# Altium project HDMI_To_FPCadaptor_V1.0.PrjPcb (part 2 of 2)

## Sheet Controller_Section.SchDoc
size A4; SheetNumber: 3; SheetTotal: 5
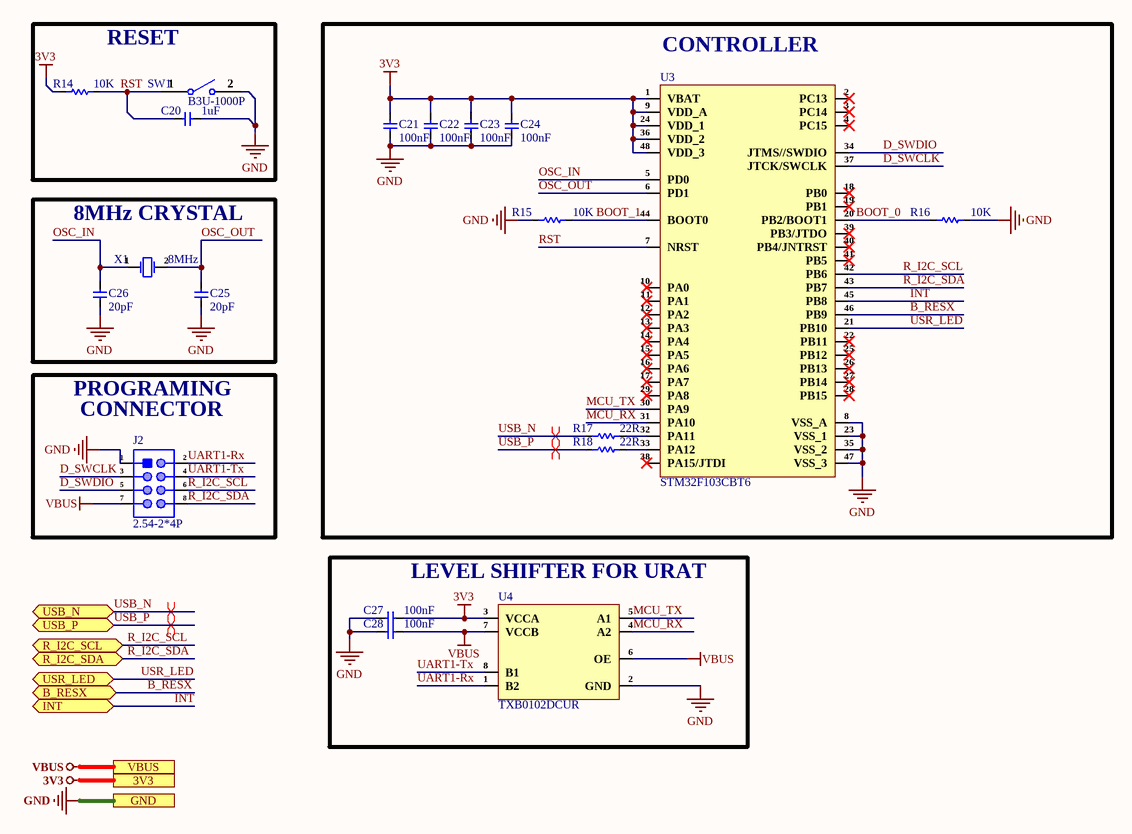
[diagram p3: Controller_Section.SchDoc]

### Parts
C20  1uF  [Cap-0603]
C21  100nF  [Cap-0603]
C22  100nF  [Cap-0603]
C23  100nF  [Cap-0603]
C24  100nF  [Cap-0603]
C25  20pF  [Cap-0603]
C26  20pF  [Cap-0603]
C27  100nF  [Cap-0603]
C28  100nF  [Cap-0603]
J2  2.54-2*4P  [C192300]
R14  10K  [Res-0603]
R15  10K  [Res-0603]
R16  10K  [Res-0603]
R17  22R  [Res-0603]
R18  22R  [Res-0603]
SW1  B3U-1000P  [B3U-1000P]
U3  STM32F103CBT6  [48-LQFP (7x7)_]
U4  TXB0102DCUR  [VSSOP-8(3.1x2.1)]
X1  8MHz  [SMD5032-2P]

### Blocks framed on the sheet
RESET: C20 R14 SW1
CONTROLLER: C21-C24 R15-R18 U3
8MHz CRYSTAL: C25 C26 X1
LEVEL SHIFTER FOR URAT: C27 C28 U4

### Ports
3V3 (see Top_Sheet[2B], HDMI_to_MIPI_Section[1D], Power_Section[3C]), B_RESX (bidir, see Top_Sheet[3B], HDMI_to_MIPI_Section[1C]), GND (see Top_Sheet[3B], Connector_Section[3C], HDMI_to_MIPI_Section[1D], Power_Section[3C]), INT (bidir, see Top_Sheet[3B], HDMI_to_MIPI_Section[1C]), R_I2C_SCL (bidir, see Top_Sheet[3B], HDMI_to_MIPI_Section[1C]), R_I2C_SDA (bidir, see Top_Sheet[3B], HDMI_to_MIPI_Section[1C]), USB_N (bidir, see Top_Sheet[2B], Power_Section[2C]), USB_P (bidir, see Top_Sheet[2B], Power_Section[2C]), USR_LED (bidir, see Top_Sheet[2B], Power_Section[2C]), VBUS (see Top_Sheet[2B], Connector_Section[3C], Power_Section[3C])

### Nets
3V3: C21.2 C22.2 C23.2 C24.2 C27.1 R14.1 U3.1(VBAT) U3.9(VDD_A) U3.24(VDD_1) U3.36(VDD_2) U3.48(VDD_3) U4.3(VCCA) ; port 3V3
GND: C20.2 C21.1 C22.1 C23.1 C24.1 C25.1 C26.1 C27.2 C28.2 J2.1 R15.1 R16.2 SW1.2 U3.8(VSS_A) U3.23(VSS_1) U3.35(VSS_2) U3.47(VSS_3) U4.2(GND) ; port GND
VBUS: C28.1 J2.7 U4.6(OE) U4.7(VCCB) ; port VBUS
B_RESX: U3.46(PB9) ; port B_RESX
BOOT_0: R16.1 U3.20(PB2/BOOT1)
BOOT_1: R15.2 U3.44(BOOT0)
D_SWCLK: J2.3 U3.37(JTCK/SWCLK)
D_SWDIO: J2.5 U3.34(JTMS//SWDIO)
INT: U3.45(PB8) ; port INT
MCU_RX: U3.31(PA10) U4.4(A2)
MCU_TX: U3.30(PA9) U4.5(A1)
OSC_IN: C26.2 U3.5(PD0) X1.1(OSC1)
OSC_OUT: C25.2 U3.6(PD1) X1.2(OSC2)
R_I2C_SCL: J2.6 U3.42(PB6) ; port R_I2C_SCL
R_I2C_SDA: J2.8 U3.43(PB7) ; port R_I2C_SDA
RST: C20.1 R14.2 SW1.1 U3.7(NRST)
UART1-Rx: J2.2 U4.1(B2)
UART1-Tx: J2.4 U4.8(B1)
USB_N: R17.1 ; port USB_N
USB_P: R18.1 ; port USB_P
USR_LED: U3.21(PB10) ; port USR_LED
NetR17_2: R17.2 U3.32(PA11)
NetR18_2: R18.2 U3.33(PA12)

Not connected (* = marked no-connect by the designer): U3 2(PC13)* 3(PC14)* 4(PC15)* 10(PA0)* 11(PA1)* 12(PA2)* 13(PA3)* 14(PA4)* 15(PA5)* 16(PA6)* 17(PA7)* 18(PB0)* 19(PB1)* 22(PB11)* 25(PB12)* 26(PB13)* 27(PB14)* 28(PB15)* 29(PA8)* 38(PA15/JTDI)* 39(PB3/JTDO)* 40(PB4/JNTRST)* 41(PB5)*

### Layout directives
differential pair; net class USB; differential pair class USB_Lines; rule Impedance Constraint [Min = 85.00    Max = 90.00    ]; rule Matched Net Lengths [Tolerance = 50mil]: USB_N, USB_P

### Notes on the sheet
- PROGRAMING
- (near J2) CONNECTOR
- File:
- Title:
- Date:
- Page
- Num:
- Total:
- Drawn By: Huzaifa Ali

### Library data of the parts
C20 = CL10A105KO8NNNC: 16V 1uF X5R ±10% 0603 Multilayer Ceramic Capacitors MLCC - SMD/SMT ROHS; Manufacturer: Samsung Electro-Mechanics; Manufacturer Part Number: CL10A105KO8NNNC; Package: 0603; LCSC Part Number: C1592; Item Type: Capacitor; ComponentLink1Description: LCSC; ComponentLink1URL: https://www.lcsc.com/product-detail/Multilayer-Ceramic-Capacitors-MLCC-SMD-SMT_Samsung-Electro-Mechanics-CL10A105KO8NNNC_C1592.html
C21-C24 C27 C28 = CL10B104KA8NNNC: 25V 100nF X7R ±10% 0603 Multilayer Ceramic Capacitors MLCC - SMD/SMT ROHS; Manufacturer: Samsung Electro-Mechanics; ComponentLink1Description: LCSC; ComponentLink1URL: https://www.lcsc.com/product-detail/Multilayer-Ceramic-Capacitors-MLCC-SMD-SMT_Samsung-Electro-Mechanics-CL10B104KA8NNNC_C1590.html; Manufacturer Part Number: CL10B104KA8NNNC; Package: 0603; LCSC Part Number: C1590; Item Type: Capacitor
C25 C26 = CC0603JRNPO9BN200: CAP CER 20PF 50V C0G/NPO 0603; Manufacturer: Yageo; Tolerance: 5%; Dielectric: C0G; Item Type: Capacitor; Supplier 1: Digi-Key; Manufacturer Part Number: CC0603JRNPO9BN200; Stock 1: 259568; Pricing 1: 1=0.1, 10=0.048, 100=0.0214, 500=0.01526, 1000=0.01198 (USD); Mount: Surface Mount; Case/Package: 0603; Number of Pins: 2; Weight: 7.1E-05oz; Case Code (Imperial): 0603; Case Code (Metric): 1608; Min Operating Temperature: -55°C; Max Operating Temperature: 125°C; Capacitance: 20pF; Package Quantity: 4000; Voltage Rating (DC): 50V; Packaging: Tape and Reel; Voltage Rating: 50V; Termination: SMD/SMT; Composition: Ceramic; Length: 1.6mm; Width: 0.8mm; Thickness: 0.035inch; Depth: 0.8mm; REACH SVHC: Unknown; Lead Free: Lead Free; ComponentLink1URL: http://www.farnell.com/datasheets/1132289.pdf?src-supplier=Element14; ComponentLink1Description: http://www.farnell.com/datasheets/1132289.pdf?src-supplier=Element14; ComponentLink2URL: http://www.yageo.com/documents/recent/UPY-GP_NP0_16V-to-50V_16.pdf?src-supplier=Digi-Key; ComponentLink2Description: http://www.yageo.com/documents/recent/UPY-GP_NP0_16V-to-50V_16.pdf?src-supplier=Digi-Key; Supplier Part Number 1: 311-1424-6-ND; LCSC Part Number: C105621
J2 = 2.54-2*4P: 3A Brick nogging Square Pins 2.5mm 8P 6mm -55℃~+105℃ 2.54mm 双排 Black 2x4P 2.54mm SMD,P=2.54mm Pin Headers ROHS; Manufacturer: BOOMELE(BOOM Precision Elec); Item Type: Male; Manufacturer Part Number: 2.54-2*4P; Package: SMD,P=2.54mm; LCSC Part Number: C192300; ComponentLink1Description: LCSC; ComponentLink1URL: https://www.lcsc.com/product-detail/Pin-Headers_BOOMELE-Boom-Precision-Elec-C192300_C192300.html
R14-R16 = 0603WAF1002T5E: 100mW Thick Film Resistors 75V ±100ppm/℃ ±1% 10kΩ 0603 Chip Resistor - Surface Mount ROHS; Manufacturer: UNI-ROYAL(Uniroyal Elec); Manufacturer Part Number: 0603WAF1002T5E; Value: 10K; Package: 0603; ComponentLink1Description: LCSC; ComponentLink1URL: https://www.lcsc.com/product-detail/Chip-Resistor-Surface-Mount_UNI-ROYAL-Uniroyal-Elec-0603WAF1002T5E_C25804.html; LCSC Part Number: C25804; Item Type: Resistor
R17 R18 = 0603WAF220JT5E: 100mW Thick Film Resistors 75V ±100ppm/℃ ±1% 22Ω 0603 Chip Resistor - Surface Mount ROHS; Manufacturer: UNI-ROYAL(Uniroyal Elec); Manufacturer Part Number: 0603WAF220JT5E; Value: 22R; Footprint: 0603; ComponentLink1Description: LCSC; ComponentLink1URL: https://www.lcsc.com/product-detail/Chip-Resistor-Surface-Mount_UNI-ROYAL-Uniroyal-Elec-0603WAF220JT5E_C23345.html; LCSC Part Number: C23345; Item Type: Resistor
SW1 = B3U-1000P: SWITCH TACTILE SPST-NO 0.05A 12V; Manufacturer: Omron; Mechanical Life: 200000Cycles; Operating Force: 1.5N; Throw Configuration: SPST; Current Rating: 50mA; Contact Resistance: 100mR; Illumination Type: Non-Illuminated,Illuminated; Switch Travel: 0.15mm; Switch Function: Off-Mom; Actuator Type: Standard; Actuator Length: 0.4mm; Ratings: Dust Proof,IP40; ComponentLink1URL: http://www.farnell.com/datasheets/60838.pdf?src-supplier=Farnell; ComponentLink1Description: http://www.farnell.com/datasheets/60838.pdf?src-supplier=Farnell; ComponentLink2URL: http://www.farnell.com/datasheets/60838.pdf?src-supplier=Element14; ComponentLink2Description: http://www.farnell.com/datasheets/60838.pdf?src-supplier=Element14; ComponentLink3URL: https://omronfs.omron.com/en_US/ecb/products/pdf/en-b3u.pdf?src-supplier=Digi-Key; ComponentLink3Description: https://omronfs.omron.com/en_US/ecb/products/pdf/en-b3u.pdf?src-supplier=Digi-Key; ComponentLink4URL: http://www.omron.com/ecb/products/pdf/en-b3u.pdf?src-supplier=Digi-Key; ComponentLink4Description: http://www.omron.com/ecb/products/pdf/en-b3u.pdf?src-supplier=Digi-Key; ComponentLink5URL: https://www.distrelec.biz/Web/Downloads/he/et/B3U_eng_datasheet.pdf?mime=application%2Fpdf&src-supplier=Distrelec; ComponentLink5Description: https://www.distrelec.biz/Web/Downloads/he/et/B3U_eng_datasheet.pdf?mime=application%2Fpdf&src-supplier=Distrelec; ComponentLink6URL: http://www.onlinecomponents.com/productFiles/mf-OM/en-b3u.pdf?src-supplier=Onlinecomponents.com; ComponentLink6Description: http://www.onlinecomponents.com/productFiles/mf-OM/en-b3u.pdf?src-supplier=Onlinecomponents.com; Supplier 1: Digi-Key; Manufacturer Part Number: B3U-1000P; Stock 1: 116454; Pricing 1: 1=1, 10=0.961, 25=0.9064, 50=0.7976, 100=0.7251, 250=0.68888, 500=0.67074, 1000=0.52571 (USD); Mount: Surface Mount; Weight: 0.000776oz; Contact Material: Silver; Min Operating Temperature: -25°C; Max Operating Temperature: 70°C; Packaging: Tape and Reel; Voltage Rating (DC): 12V; Package Quantity: 1; Max Current Rating: 50mA; Termination: SMD/SMT; Orientation: Straight; Max Voltage Rating (DC): 12V; Electrical Life: 200000Cycles; Insulation Resistance: 100MR; Contact Current Rating: 50mA; Length: 4mm; Height: 1.2mm; Depth: 2.5mm; Width: 3mm; REACH SVHC: Unknown; Lead Free: Lead Free; ComponentLink7URL: https://www.verical.com/server-webapp/html/getDatasheet?partID=552554&src-supplier=Verical; ComponentLink7Description: https://www.verical.com/server-webapp/html/getDatasheet?partID=552554&src-supplier=Verical; ComponentLink8URL: http://www.farnell.com/datasheets/1685550.pdf?src-supplier=Element14; ComponentLink8Description: http://www.farnell.com/datasheets/1685550.pdf?src-supplier=Element14; ComponentLink9URL: http://www.farnell.com/datasheets/2610940.pdf?src-supplier=Farnell; ComponentLink9Description: http://www.farnell.com/datasheets/2610940.pdf?src-supplier=Farnell; ComponentLink10URL: https://www.alliedelec.com/m/d/4c8a9ef82804fc3c241a13c1e298fd73.pdf?src-supplier=Allied+Electronics; ComponentLink10Description: https://www.alliedelec.com/m/d/4c8a9ef82804fc3c241a13c1e298fd73.pdf?src-supplier=Allied+Electronics; Supplier Part Number 1: SW1020DKR-ND; LCSC Part Number: C231329; Item Type: Switch
U3 = STM32F103CBT6: IC MCU 32BIT 128KB FLASH 48LQFP; Manufacturer: STMicroelectronics; RAM Size: 20KB; Max Power Dissipation: 363mW; Interface: I2C,SPI,USB,CAN,IrDA,UART,USART,LIN; Number of I/Os: 37; Number of Timers/Counters: 4; Max Supply Voltage: 3.6V; Number of PWM Channels: 12; Frequency: 72MHz; Number of ADC Channels: 10; Min Supply Voltage: 2V; Oscillator Type: Internal; Data Bus Width: 32b; Number of Bits: 32; Number of SPI Channels: 2; Watchdog Timer: Yes; Peripherals: POR,PWM,WDT,DMA,Temp Sensor,I2C; Core Architecture: ARM; Supplier: Mouser; Supplier Part Number: 511-STM32F103CBT6; Manufacturer Part Number: STM32F103CBT6; RoHS: Yes; Category: Microcontrollers; Stock: 3552; Pricing: 1=7.35, 10=6.65, 50=5.53, 100=5.49, 1000=4.31, 10000=4.25 (USD); Case/Package: LQFP; Pins: 48; Min Operating Temperature: -40°C; Max Operating Temperature: 85°C; Package Quantity: 250; Density: 128KB; Packaging: Tray; Number of Programmable I/O: 37; Clock Frequency: 72MHz; Number of I2C Channels: 2; Memory Format: FLASH; Termination: SMD/SMT; Address Bus Width: 32b; Memory Size: 128KB; Series: STM32 F1; Length: 7mm; Width: 7.2mm; Height: 1.45mm; Radiation Hardening: No; Reach SVHC Compliant: No; Lead Free: Lead Free; RoHS Compliant: Yes; ComponentLink1URL: https://datasheet.ciiva.com/23669/1714663-23669200.pdf?src-supplier=Newark; ComponentLink1Description: https://datasheet.ciiva.com/23669/1714663-23669200.pdf?src-supplier=Newark; ComponentLink2URL: https://datasheet.ciiva.com/15122/getdatasheetpartid-92132-15122195.pdf?src-supplier=Verical; ComponentLink2Description: https://datasheet.ciiva.com/15122/getdatasheetpartid-92132-15122195.pdf?src-supplier=Verical; ComponentLink3URL: https://datasheet.ciiva.com/5752/cd00161566-5752838.pdf?src-supplier=Farnell; ComponentLink3Description: https://datasheet.ciiva.com/5752/cd00161566-5752838.pdf?src-supplier=Farnell; ComponentLink4URL: https://datasheet.ciiva.com/14100/pustm-arm-microcont-stm32f103-en-14100509.pdf?src-supplier=Distrelec; ComponentLink4Description: https://datasheet.ciiva.com/14100/pustm-arm-microcont-stm32f103-en-14100509.pdf?src-supplier=Distrelec; ComponentLink5URL: https://datasheet.ciiva.com/1502/cd00161566-1502328.pdf?src-supplier=Digi-Key; ComponentLink5Description: https://datasheet.ciiva.com/1502/cd00161566-1502328.pdf?src-supplier=Digi-Key; ComponentLink6URL: https://datasheet.ciiva.com/4840/cd00161566-4840398.pdf?src-supplier=Mouser; ComponentLink6Description: https://datasheet.ciiva.com/4840/cd00161566-4840398.pdf?src-supplier=Mouser; ComponentLink7URL: https://datasheet.ciiva.com/16219/cd00161566-16219150.pdf?src-supplier=Future+Electronics; ComponentLink7Description: https://datasheet.ciiva.com/16219/cd00161566-16219150.pdf?src-supplier=Future+Electronics; Item Type: IC; LCSC Part Number: C8304
U4 = TXB0102DCUR: IC TRANSLTR BIDIRECTIONAL 8VSSOP; Manufacturer: Texas Instruments; Number of Circuits: 1; Nominal Supply Current: 3.5uA; Number of Inputs: 1NUMBER; Max Supply Voltage: 5.5V; Min Supply Voltage: 1.2V; Propagation Delay: 7.4ns; Data Rate: 100Mbps; Logic Function: Translator; Number of Bits: 2; Turn-On Delay Time: 31ns; High Level Output Current: -20uA; Low Level Output Current: 20uA; Output Type: 3-STATE; Supplier: Digikey; Supplier Part Number: 296-22862-1-ND; Manufacturer Part Number: TXB0102DCUR; RoHS: Yes; Category: Voltage Level Shifters; Stock: 10593; Pricing: 1=0.69, 10=0.606, 25=0.5696, 100=0.4649, 250=0.4318, 500=0.36748, 1000=0.29398 (USD); Mounting Technology: Surface Mount; Case/Package: VSSOP; Pins: 8; Weight: 0.000339oz; Min Operating Temperature: -40°C; Max Operating Temperature: 85°C; Number of Outputs: 1NUMBER; Packaging: Tape and Reel; Package Quantity: 3000; Series: -; Channel Type: Bidirectional; Length: 2.3mm; Width: 2mm; Height: 900um; Thickness: 850um; Radiation Hardening: No; Reach SVHC Compliant: No; Lead Free: Lead Free; RoHS Compliant: Yes; ComponentLink1URL: https://datasheet.ciiva.com/7744/1634161-7744195.pdf?src-supplier=Element14; ComponentLink1Description: https://datasheet.ciiva.com/7744/1634161-7744195.pdf?src-supplier=Element14; ComponentLink2URL: https://datasheet.ciiva.com/22677/1699360-22677930.pdf?src-supplier=Element14; ComponentLink2Description: https://datasheet.ciiva.com/22677/1699360-22677930.pdf?src-supplier=Element14; ComponentLink3URL: https://datasheet.ciiva.com/4226/sces641b-4226960.pdf?src-supplier=Arrow+Electronics; ComponentLink3Description: https://datasheet.ciiva.com/4226/sces641b-4226960.pdf?src-supplier=Arrow+Electronics; ComponentLink4URL: https://datasheet.ciiva.com/15096/getdatasheetpartid-214907-15096235.pdf?src-supplier=Verical; ComponentLink4Description: https://datasheet.ciiva.com/15096/getdatasheetpartid-214907-15096235.pdf?src-supplier=Verical; ComponentLink5URL: https://datasheet.ciiva.com/6132/txb0102-6132717.pdf?src-supplier=Farnell; ComponentLink5Description: https://datasheet.ciiva.com/6132/txb0102-6132717.pdf?src-supplier=Farnell; ComponentLink6URL: https://datasheet.ciiva.com/46384/1874809-46384198.pdf?src-supplier=Element14; ComponentLink6Description: https://datasheet.ciiva.com/46384/1874809-46384198.pdf?src-supplier=Element14; ComponentLink7URL: https://datasheet.ciiva.com/1899/txb0102-1899430.pdf?src-supplier=Digikey; ComponentLink7Description: https://datasheet.ciiva.com/1899/txb0102-1899430.pdf?src-supplier=Digikey; ComponentLink8URL: https://datasheet.ciiva.com/1899/txb0102-1899429.pdf?src-supplier=Digikey; ComponentLink8Description: https://datasheet.ciiva.com/1899/txb0102-1899429.pdf?src-supplier=Digikey; ComponentLink9URL: https://datasheet.ciiva.com/1899/txb0102-1899431.pdf?src-supplier=Digikey; ComponentLink9Description: https://datasheet.ciiva.com/1899/txb0102-1899431.pdf?src-supplier=Digikey; ComponentLink10URL: https://datasheet.ciiva.com/14287/txb0102-14287496.pdf?src-supplier=Avnet; ComponentLink10Description: https://datasheet.ciiva.com/14287/txb0102-14287496.pdf?src-supplier=Avnet; LCSC Part Number: C60709; Type: IC; ComponentLink11Description: LCSC; ComponentLink11URL: https://www.lcsc.com/product-detail/Translators-Level-Shifters_Texas-Instruments-TXB0102DCUR_C60709.html
X1 = X50328MSB2GI: 8MHz 20pF ±10ppm ±50ppm SMD5032-2P Crystals ROHS; Manufacturer: Yangxing Tech; Manufacturer Part Number: X50328MSB2GI; Package: SMD5032-2P; LCSC Part Number: C115962; Item Type: Crystal; ComponentLink1Description: LCSC; ComponentLink1URL: https://www.lcsc.com/product-detail/Crystals_Yangxing-Tech-X50328MSB2GI_C115962.html

## Sheet HDMI_to_MIPI_Section.SchDoc
size A4; SheetNumber: 4; SheetTotal: 5
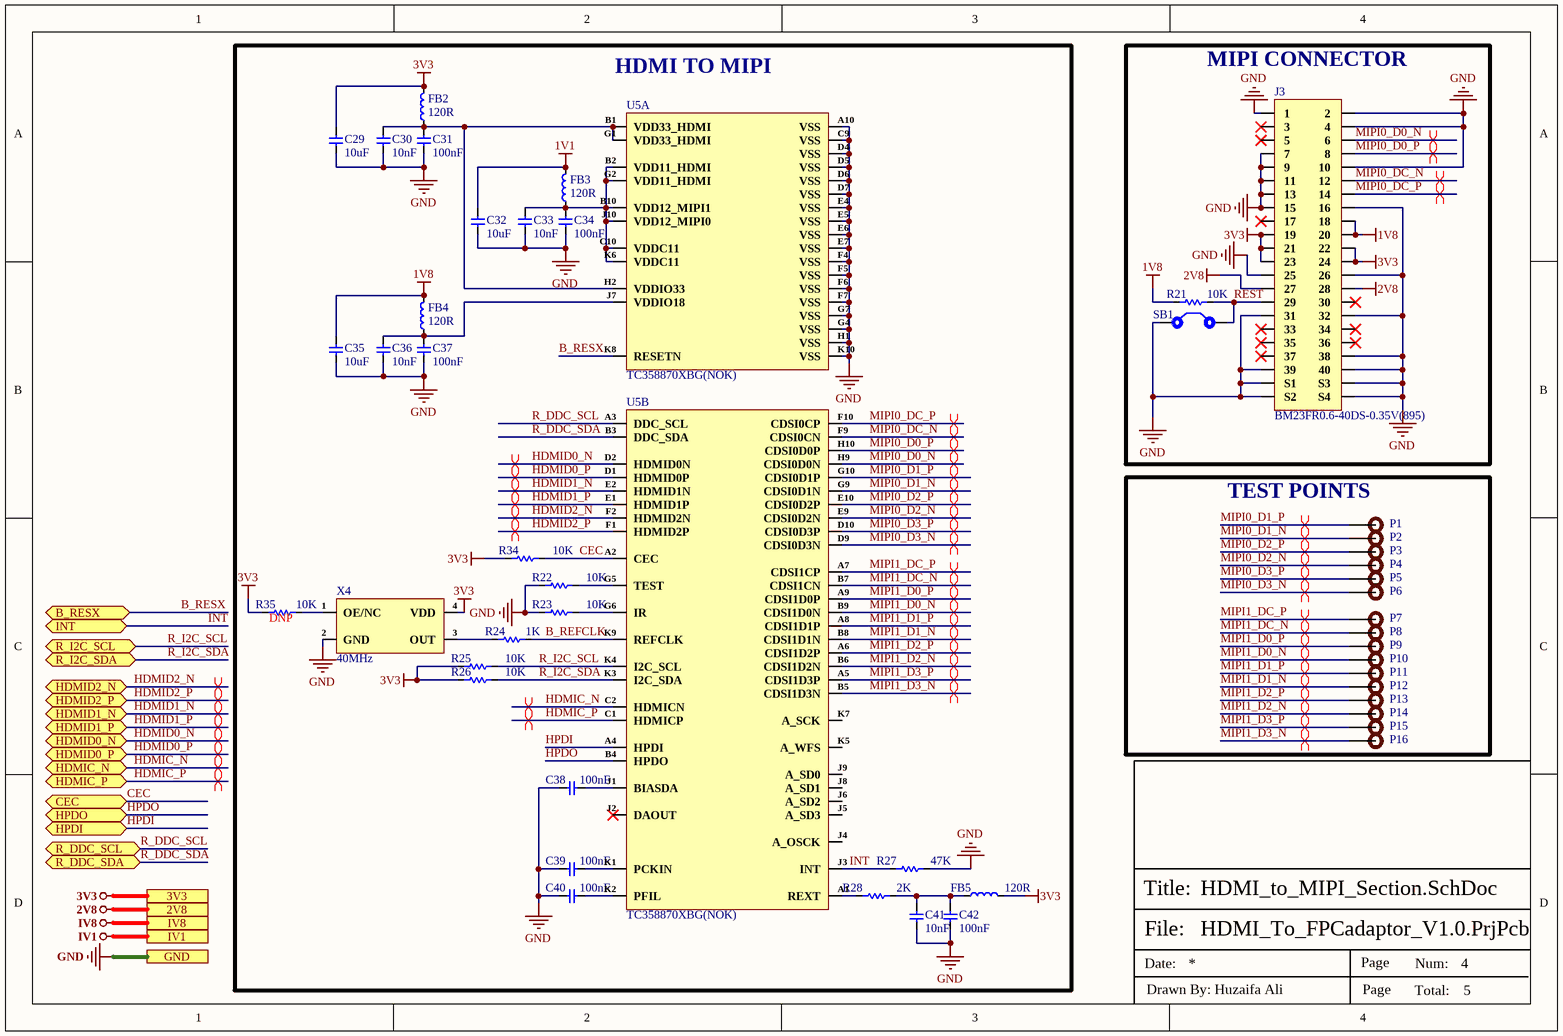
[diagram p4: HDMI_to_MIPI_Section.SchDoc]

### Parts
C29  10uF  [Cap-0603]
C30  10nF  [Cap-0603]
C31  100nF  [Cap-0603]
C32  10uF  [Cap-0603]
C33  10nF  [Cap-0603]
C34  100nF  [Cap-0603]
C35  10uF  [Cap-0603]
C36  10nF  [Cap-0603]
C37  100nF  [Cap-0603]
C38  100nF  [Cap-0603]
C39  100nF  [Cap-0603]
C40  100nF  [Cap-0603]
C41  10nF  [Cap-0603]
C42  100nF  [Cap-0603]
FB2  120R  [IND-0603 (1608 Metric)]
FB3  120R  [IND-0603 (1608 Metric)]
FB4  120R  [IND-0603 (1608 Metric)]
FB5  120R  [IND-0603 (1608 Metric)]
J3  BM23FR0.6-40DS-0.35V(895)  [BM23FR0.6-40DS-0.35V(895)]
P1  TEST POINT  [Test-point - 0.5mm]  (value not drawn)  (no BOM)
P2  TEST POINT  [Test-point - 0.5mm]  (value not drawn)  (no BOM)
P3  TEST POINT  [Test-point - 0.5mm]  (value not drawn)  (no BOM)
P4  TEST POINT  [Test-point - 0.5mm]  (value not drawn)  (no BOM)
P5  TEST POINT  [Test-point - 0.5mm]  (value not drawn)  (no BOM)
P6  TEST POINT  [Test-point - 0.5mm]  (value not drawn)  (no BOM)
P7  TEST POINT  [Test-point - 0.5mm]  (value not drawn)  (no BOM)
P8  TEST POINT  [Test-point - 0.5mm]  (value not drawn)  (no BOM)
P9  TEST POINT  [Test-point - 0.5mm]  (value not drawn)  (no BOM)
P10  TEST POINT  [Test-point - 0.5mm]  (value not drawn)  (no BOM)
P11  TEST POINT  [Test-point - 0.5mm]  (value not drawn)  (no BOM)
P12  TEST POINT  [Test-point - 0.5mm]  (value not drawn)  (no BOM)
P13  TEST POINT  [Test-point - 0.5mm]  (value not drawn)  (no BOM)
P14  TEST POINT  [Test-point - 0.5mm]  (value not drawn)  (no BOM)
P15  TEST POINT  [Test-point - 0.5mm]  (value not drawn)  (no BOM)
P16  TEST POINT  [Test-point - 0.5mm]  (value not drawn)  (no BOM)
R21  10K  [Res-0603]
R22  10K  [Res-0603]
R23  10K  [Res-0603]
R24  1K  [Res-0603]
R25  10K  [Res-0603]
R26  10K  [Res-0603]
R27  47K  [Res-0603]
R28  2K  [Res-0603]
R34  10K  [Res-0603]
R35  10K  [Res-0603]
SB1  Solder Bridge 0603  [Solder Bridge]  (value not drawn)  (no BOM)
U5  TC358870XBG(NOK)  [TC358870XBG]  (parts A,B of 2)
X4  40MHz  [SMD3225-4P]

### Blocks framed on the sheet
HDMI TO MIPI: C29-C42 FB2-FB5 R22-R28 R34 R35 U5 X4
MIPI CONNECTOR: J3 R21 SB1
TEST POINTS: P1-P16

### Ports
2V8 (see Top_Sheet[3B], Power_Section[3C]), 3V3 (see Top_Sheet[3B], Controller_Section[1D], Power_Section[3C]), B_RESX (bidir, see Top_Sheet[3B], Controller_Section[1D]), CEC (bidir, see Top_Sheet[3C], Connector_Section[2D]), GND (see Top_Sheet[4C], Connector_Section[3C], Controller_Section[1D], Power_Section[3C]), HDMIC_N (bidir, see Top_Sheet[3B], Connector_Section[2D]), HDMIC_P (bidir, see Top_Sheet[3B], Connector_Section[2D]), HDMID0_N (bidir, see Top_Sheet[3B], Connector_Section[2D]), HDMID0_P (bidir, see Top_Sheet[3B], Connector_Section[2D]), HDMID1_N (bidir, see Top_Sheet[3B], Connector_Section[2C]), HDMID1_P (bidir, see Top_Sheet[3B], Connector_Section[2D]), HDMID2_N (bidir, see Top_Sheet[3B], Connector_Section[2C]), HDMID2_P (bidir, see Top_Sheet[3B], Connector_Section[2C]), HPDI (bidir, see Top_Sheet[3C], Connector_Section[2D]), HPDO (bidir, see Top_Sheet[3C], Connector_Section[2D]), INT (bidir, see Top_Sheet[3B], Controller_Section[1D]), IV1 (see Top_Sheet[3B], Power_Section[3C]), IV8 (see Top_Sheet[3B], Power_Section[3C]), R_DDC_SCL (bidir, see Top_Sheet[3B], Connector_Section[2D]), R_DDC_SDA (bidir, see Top_Sheet[3B], Connector_Section[2D]), R_I2C_SCL (bidir, see Top_Sheet[3B], Controller_Section[1D]), R_I2C_SDA (bidir, see Top_Sheet[3B], Controller_Section[1D])

### Nets
1V1: C32.2 FB3.2
1V8: C35.2 FB4.2 J3.18 J3.20 R21.1
2V8: J3.27 J3.28 ; port 2V8
3V3: C29.2 FB2.2 FB5.2 J3.19 J3.21 J3.22 J3.23 J3.24 R25.1 R26.1 R34.1 R35.1 X4.4(VDD) ; port 3V3
GND: C29.1 C30.1 C31.1 C32.1 C33.1 C34.1 C35.1 C36.1 C37.1 C38.1 C39.1 C40.1 C41.1 C42.1 J3.1 J3.2 J3.4 J3.7 J3.9 J3.10 J3.11 J3.13 J3.15 J3.16 J3.25 J3.26 J3.31 J3.32 J3.38 J3.39 J3.40 J3.S1 J3.S2 J3.S3 J3.S4 R22.1 R23.1 R27.2 SB1.1 U5.A10(VSS) U5.C9(VSS) U5.D4(VSS) U5.D5(VSS) U5.D6(VSS) U5.D7(VSS) U5.E4(VSS) U5.E5(VSS) U5.E6(VSS) U5.E7(VSS) U5.F4(VSS) U5.F5(VSS) U5.F6(VSS) U5.F7(VSS) U5.G4(VSS) U5.G7(VSS) U5.H1(VSS) U5.K10(VSS) X4.2(GND) ; port GND
B_REFCLK: R24.1 U5.K9(REFCLK)
B_RESX: U5.K8(RESETN) ; port B_RESX
CEC: R34.2 U5.A2(CEC) ; port CEC
HDMIC_N: U5.C2(HDMICN) ; port HDMIC_N
HDMIC_P: U5.C1(HDMICP) ; port HDMIC_P
HDMID0_N: U5.D2(HDMID0N) ; port HDMID0_N
HDMID0_P: U5.D1(HDMID0P) ; port HDMID0_P
HDMID1_N: U5.E2(HDMID1N) ; port HDMID1_N
HDMID1_P: U5.E1(HDMID1P) ; port HDMID1_P
HDMID2_N: U5.F2(HDMID2N) ; port HDMID2_N
HDMID2_P: U5.F1(HDMID2P) ; port HDMID2_P
HPDI: U5.A4(HPDI) ; port HPDI
HPDO: U5.B4(HPDO) ; port HPDO
INT: R27.1 U5.J3(INT) ; port INT
MIPI0_D0_N: J3.6 U5.H9(CDSI0D0N)
MIPI0_D0_P: J3.8 U5.H10(CDSI0D0P)
MIPI0_D1_N: P2.1 U5.G9(CDSI0D1N)
MIPI0_D1_P: P1.1 U5.G10(CDSI0D1P)
MIPI0_D2_N: P4.1 U5.E9(CDSI0D2N)
MIPI0_D2_P: P3.1 U5.E10(CDSI0D2P)
MIPI0_D3_N: P6.1 U5.D9(CDSI0D3N)
MIPI0_D3_P: P5.1 U5.D10(CDSI0D3P)
MIPI0_DC_N: J3.12 U5.F9(CDSI0CN)
MIPI0_DC_P: J3.14 U5.F10(CDSI0CP)
MIPI1_D0_N: P10.1 U5.B9(CDSI1D0N)
MIPI1_D0_P: P9.1 U5.A9(CDSI1D0P)
MIPI1_D1_N: P12.1 U5.B8(CDSI1D1N)
MIPI1_D1_P: P11.1 U5.A8(CDSI1D1P)
MIPI1_D2_N: P14.1 U5.B6(CDSI1D2N)
MIPI1_D2_P: P13.1 U5.A6(CDSI1D2P)
MIPI1_D3_N: P16.1 U5.B5(CDSI1D3N)
MIPI1_D3_P: P15.1 U5.A5(CDSI1D3P)
MIPI1_DC_N: P8.1 U5.B7(CDSI1CN)
MIPI1_DC_P: P7.1 U5.A7(CDSI1CP)
R_DDC_SCL: U5.A3(DDC_SCL) ; port R_DDC_SCL
R_DDC_SDA: U5.B3(DDC_SDA) ; port R_DDC_SDA
R_I2C_SCL: R25.2 U5.K4(I2C_SCL) ; port R_I2C_SCL
R_I2C_SDA: R26.2 U5.K3(I2C_SDA) ; port R_I2C_SDA
REST: J3.29 R21.2 SB1.2
NetC30_2: C30.2 C31.2 FB2.1 U5.B1(VDD33_HDMI) U5.G1(VDD33_HDMI) U5.H2(VDDIO33)
NetC33_2: C33.2 C34.2 FB3.1 U5.B2(VDD11_HDMI) U5.B10(VDD12_MIPI1) U5.C10(VDDC11) U5.G2(VDD11_HDMI) U5.J10(VDD12_MIPI0) U5.K6(VDDC11)
NetC36_2: C36.2 C37.2 FB4.1 U5.J7(VDDIO18)
NetC38_2: C38.2 U5.J1(BIASDA)
NetC39_2: C39.2 U5.K1(PCKIN)
NetC40_2: C40.2 U5.K2(PFIL)
NetC41_2: C41.2 C42.2 FB5.1 R28.2
NetR22_2: R22.2 U5.G5(TEST)
NetR23_2: R23.2 U5.G6(IR)
NetR24_2: R24.2 X4.3(OUT)
NetR28_1: R28.1 U5.A1(REXT)
NetR35_2: R35.2 X4.1(OE/NC)

Not connected (* = marked no-connect by the designer): J3 3* 5* 17* 30* 33* 34* 35* 36* 37*; U5 J2(DAOUT)* J4(A_OSCK) J5(A_SD3) J6(A_SD2) J8(A_SD1) J9(A_SD0) K5(A_WFS) K7(A_SCK)

### Layout directives
differential pair; net class HDMI; differential pair class HDMI_Lines; rule Impedance Constraint [Min = 95.00    Max = 100.0    ]; rule Matched Net Lengths [Tolerance = 5mil]: HDMIC_N, HDMIC_P, HDMID0_N, HDMID0_P, HDMID1_N, HDMID1_P, HDMID2_N, HDMID2_P
differential pair; net class MIPI; differential pair class MIPI_Lines; rule Impedance Constraint [Min = 95.00    Max = 100.0    ]; rule Matched Net Lengths [Tolerance = 15mil]: MIPI0_D0_N, MIPI0_D0_P, MIPI0_D1_N, MIPI0_D1_P, MIPI0_D2_N, MIPI0_D2_P, MIPI0_D3_N, MIPI0_D3_P, MIPI0_DC_N, MIPI0_DC_P, MIPI1_D0_N, MIPI1_D0_P, MIPI1_D1_N, MIPI1_D1_P, MIPI1_D2_N, MIPI1_D2_P, MIPI1_D3_N, MIPI1_D3_P, MIPI1_DC_N, MIPI1_DC_P

### Notes on the sheet
- (near R35) DNP
- File:
- Title:
- Date:
- Page
- Num:
- Total:
- Drawn By: Huzaifa Ali

### Library data of the parts
C29 C32 C35 = CGA0603X5R106K100JT: 10V 10uF X5R ±10% 0603 Multilayer Ceramic Capacitors MLCC - SMD/SMT ROHS; Manufacturer: HRE; ComponentLink1Description: LCSC; ComponentLink1URL: https://www.lcsc.com/product-detail/Multilayer-Ceramic-Capacitors-MLCC-SMD-SMT_HRE-CGA0603X5R106K100JT_C6119842.html; Manufacturer Part Number: CGA0603X5R106K100JT; Package: 0603; LCSC Part Number: C6119842; Item Type: Capacitor
C30 C33 C36 C41 = FN18X103K500PSG: 50V 10nF X7R ±10% 0603 Multilayer Ceramic Capacitors MLCC - SMD/SMT ROHS; Manufacturer: PSA; Manufacturer Part Number: FN18X103K500PSG; Package: 0603; LCSC Part Number: C525264; Item Type: Capacitor; ComponentLink1Description: LCSC; ComponentLink1URL: https://www.lcsc.com/product-detail/Multilayer-Ceramic-Capacitors-MLCC-SMD-SMT_PSA-Prosperity-Dielectrics-FN18X103K500PSG_C525264.html
C31 C34 C37-C40 C42 = CL10B104KA8NNNC: as C21 on sheet Controller_Section; ComponentLink1Description: LCSC; ComponentLink1URL: https://www.lcsc.com/product-detail/Multilayer-Ceramic-Capacitors-MLCC-SMD-SMT_Samsung-Electro-Mechanics-CL10B104KA8NNNC_C1590.html; Manufacturer Part Number: CL10B104KA8NNNC; Package: 0603; LCSC Part Number: C1590; Item Type: Capacitor
FB2-FB5 = BLM18PG121SN1D: Ferrite Beads Multi-Layer 120Ohm 25% 100MHz 2A 50mOhm DCR 0603 Paper T/R; Manufacturer: Murata Electronics; Material: Steel,Ferrite; Number of Lines: 1; DC Resistance (DCR): 50mR; Shielding: Unshielded; Manufacturer Part Number: BLM18PG121SN1D; Package: 0603; LCSC Part Number: C14709; Item Type: Ferrite Bead; ComponentLink1Description: LCSC; ComponentLink1URL: https://www.lcsc.com/product-detail/Ferrite-Beads_Murata-Electronics-BLM18PG121SN1D_C14709.html; Supplier: Digikey; Supplier Part Number: 490-1037-1-ND; RoHS: Yes; Category: Ferrite Beads and Chips; Stock: 1240; Pricing: 1=0.1, 10=0.078, 25=0.0712, 50=0.064, 100=0.0469, 250=0.03412, 500=0.03128, 1000=0.02701 (USD); Case/Package: 0603; Pins: 2; Core Material: Ferrite; Case Code (Metric): 1608; Case Code (Imperial): 0603; Min Operating Temperature: -55°C; Max Operating Temperature: 125°C; Tolerance: 25%; Impedance: 120R; Package Quantity: 1; Max Current Rating: 2A; Packaging: Tape and Reel; Current Rating: 2A; Max DC Current: 2A; Termination: SMD/SMT; Test Frequency: 100MHz; DC Current: 2A; Frequency: 100MHz; Number of Circuits: 1; Series: BLM18P; DC Resistance-Max: 50mR; RMS Current (Irms): 2A; ESR: 50mR; Length: 1.6mm; Width: 0.8mm; Height: 0.8mm; Depth: 0.8mm; Radiation Hardening: No; Reach SVHC Compliant: No; Lead Free: Lead Free; RoHS Compliant: Yes; ComponentLink2URL: https://datasheet.ciiva.com/5709/1740433-5709171.pdf?src-supplier=Farnell; ComponentLink2Description: https://datasheet.ciiva.com/5709/1740433-5709171.pdf?src-supplier=Farnell; ComponentLink3URL: https://datasheet.ciiva.com/19454/1845013-19454715.pdf?src-supplier=Jameco; ComponentLink3Description: https://datasheet.ciiva.com/19454/1845013-19454715.pdf?src-supplier=Jameco; ComponentLink4URL: https://datasheet.ciiva.com/11799/0900766b81275ca5-11799546.pdf?src-supplier=Rs; ComponentLink4Description: https://datasheet.ciiva.com/11799/0900766b81275ca5-11799546.pdf?src-supplier=Rs; ComponentLink5URL: https://datasheet.ciiva.com/3854/5emiapbde-1-3854039.pdf?src-supplier=Arrow+Electronics; ComponentLink5Description: https://datasheet.ciiva.com/3854/5emiapbde-1-3854039.pdf?src-supplier=Arrow+Electronics; ComponentLink6URL: https://datasheet.ciiva.com/29347/442365-da-01-en-chip-drossel-0603-120r-2000ma-1-6x0-8mm-29347911.pdf?src-supplier=Conrad; ComponentLink6Description: https://datasheet.ciiva.com/29347/442365-da-01-en-chip-drossel-0603-120r-2000ma-1-6x0-8mm-29347911.pdf?src-supplier=Conrad; ComponentLink7URL: https://datasheet.ciiva.com/8021/1740433-8021493.pdf?src-supplier=Element14; ComponentLink7Description: https://datasheet.ciiva.com/8021/1740433-8021493.pdf?src-supplier=Element14; ComponentLink8URL: https://datasheet.ciiva.com/8021/1740433-8021494.pdf?src-supplier=Element14; ComponentLink8Description: https://datasheet.ciiva.com/8021/1740433-8021494.pdf?src-supplier=Element14; ComponentLink9URL: https://datasheet.ciiva.com/14122/blm-series-eng-tds-14122905.pdf?src-supplier=Distrelec; ComponentLink9Description: https://datasheet.ciiva.com/14122/blm-series-eng-tds-14122905.pdf?src-supplier=Distrelec; ComponentLink10URL: https://datasheet.ciiva.com/6212/l0110s0100blm18p-6212502.pdf?src-supplier=Digikey; ComponentLink10Description: https://datasheet.ciiva.com/6212/l0110s0100blm18p-6212502.pdf?src-supplier=Digikey; ComponentLink11URL: https://datasheet.ciiva.com/6212/l0110s0100blm18p-6212504.pdf?src-supplier=Digikey; ComponentLink11Description: https://datasheet.ciiva.com/6212/l0110s0100blm18p-6212504.pdf?src-supplier=Digikey; ComponentLink12URL: https://datasheet.ciiva.com/3081/l0110s0100blm18p-3081632.pdf?src-supplier=Avnet; ComponentLink12Description: https://datasheet.ciiva.com/3081/l0110s0100blm18p-3081632.pdf?src-supplier=Avnet; ComponentLink13URL: https://datasheet.ciiva.com/41449/001172297-da-01-en-drossel-0603-120r-1-6x0-8mm-4000st-41449659.pdf?src-supplier=Conrad; ComponentLink13Description: https://datasheet.ciiva.com/41449/001172297-da-01-en-drossel-0603-120r-1-6x0-8mm-4000st-41449659.pdf?src-supplier=Conrad
J3 = BM23FR0.6-40DS-0.35V(895): 40 Position Straight Type Receptacle Signal Only Board to FPC Connector; Manufacturer: Hirose; Supplier: Mouser; Supplier Part Number: 798-3FR0640DS035V895; Manufacturer Part Number: BM23FR0.6-40DS-0.35V(895); RoHS: Yes; Category: Connectors; Stock: 1106; Pricing: 1=1.5, 10=1.23, 50=1.23, 100=1.06, 1000=0.833, 10000=0.722 (USD); ComponentLink1URL: https://www.hirose.com/product/download/?distributor=digikey&amp;type=specSheet&amp;lang=en&amp;num=BM23FR0.6-40DS-0.35V(895)&src-supplier=Digikey; ComponentLink1Description: https://www.hirose.com/product/download/?distributor=digikey&amp;type=specSheet&amp;lang=en&amp;num=BM23FR0.6-40DS-0.35V(895)&src-supplier=Digikey; Item Type: Connector
P1-P16 = TEST POINT: Test Point ON; Item Type: TEST POINT
R21-R23 R25 R26 R34 R35 = 0603WAF1002T5E: as R14 on sheet Controller_Section; Manufacturer Part Number: 0603WAF1002T5E; Value: 10K; Package: 0603; ComponentLink1Description: LCSC; ComponentLink1URL: https://www.lcsc.com/product-detail/Chip-Resistor-Surface-Mount_UNI-ROYAL-Uniroyal-Elec-0603WAF1002T5E_C25804.html; LCSC Part Number: C25804; Item Type: Resistor
R24 = RC0603FR-071KL: RES SMD 1K OHM 1% 1/10W 0603; Manufacturer: Yageo; Resistance: 1kR; Temperature Coefficient: 100ppm/°C; Power Rating: 100mW; Voltage Rating: 50V; Item type: Resistor; ComponentLink1URL: https://www.verical.com/server-webapp/html/getDatasheet?partID=409289&src-supplier=Verical; ComponentLink1Description: https://www.verical.com/server-webapp/html/getDatasheet?partID=409289&src-supplier=Verical; Supplier 1: Digi-Key; Manufacturer Part Number: RC0603FR-071KL; Stock 1: 21472395; Pricing 1: 1=0.1, 10=0.023, 100=0.0094, 1000=0.0042, 2500=0.0037 (USD); Case/Package: 0603; Contact Plating: Tin,Matte; Case Code (Imperial): 0603; Case Code (Metric): 1608; Min Operating Temperature: -55°C; Max Operating Temperature: 155°C; Tolerance: 1%; Composition: Thick Film; Packaging: Tape and Reel; Termination: SMD/SMT; Military Standard: Not; Length: 1.6mm; Height: 0.45mm; Depth: 0.8mm; Radiation Hardening: No; REACH SVHC: No SVHC; Lead Free: Lead Free; ComponentLink2URL: http://documents.rs-components.com/techlib://itc_doclist_GB.htm?stockno=5048928&src-supplier=RSComponents; ComponentLink2Description: http://documents.rs-components.com/techlib://itc_doclist_GB.htm?stockno=5048928&src-supplier=RSComponents; ComponentLink3URL: http://www.yageo.com/documents/recent/PYu-RC0603_51_RoHS_L_4.pdf?src-supplier=Avnet+Europe; ComponentLink3Description: http://www.yageo.com/documents/recent/PYu-RC0603_51_RoHS_L_4.pdf?src-supplier=Avnet+Europe; ComponentLink4URL: http://www.farnell.com/datasheets/2167052.pdf?src-supplier=Element14; ComponentLink4Description: http://www.farnell.com/datasheets/2167052.pdf?src-supplier=Element14; ComponentLink5URL: http://www.farnell.com/datasheets/1868787.pdf?src-supplier=Element14; ComponentLink5Description: http://www.farnell.com/datasheets/1868787.pdf?src-supplier=Element14; ComponentLink6URL: http://www.yageo.com/documents/recent/PYu-RC_Group_51_RoHS_L_2.pdf?src-supplier=Avnet; ComponentLink6Description: http://www.yageo.com/documents/recent/PYu-RC_Group_51_RoHS_L_2.pdf?src-supplier=Avnet; ComponentLink7URL: https://www.verical.com/server-webapp/html/getDatasheet?partID=404327&src-supplier=Verical; ComponentLink7Description: https://www.verical.com/server-webapp/html/getDatasheet?partID=404327&src-supplier=Verical; ComponentLink8URL: http://www.farnell.com/datasheets/443971.pdf?src-supplier=Element14; ComponentLink8Description: http://www.farnell.com/datasheets/443971.pdf?src-supplier=Element14; Supplier Part Number 1: 311-1.00KHRDKR-ND; LCSC Part Number: C22548
R27 = RC0603JR-0747KL: RES 47K OHM 5% 1/10W 0603; Manufacturer: Yageo; Resistance: 47kR; Power Rating: 100mW; Voltage Rating (DC): 50V; Temperature Coefficient: 100ppm/°C; Resistance Tolerance: 1%; Supplier 1: Arrow; Manufacturer Part Number: RC0603JR-0747KL; Stock 1: 599135; Pricing 1: 5000=0.0025, 10000=0.0022, 25000=0.0019, 1=0.0011, 6000=0.001 (USD); Case/Package: 0603; Number of Pins: 2; Case Code (Imperial): 0603; Case Code (Metric): 1608; Min Operating Temperature: -55°C; Max Operating Temperature: 155°C; Packaging: Tape and Reel; Tolerance: 5%; Voltage Rating: 50V; Package Quantity: 5000; Termination: SMD/SMT; Military Standard: Not; Composition: Thick Film; Length: 1.6mm; Height: 0.45mm; Width: 0.8mm; Depth: 0.8mm; REACH SVHC: No SVHC; Lead Free: Lead Free; ComponentLink1URL: http://www.farnell.com/datasheets/443971.pdf; ComponentLink1Description: http://www.farnell.com/datasheets/443971.pdf; ComponentLink2URL: http://www.mouser.com/catalog/specsheets/RC0603.pdf; ComponentLink2Description: http://www.mouser.com/catalog/specsheets/RC0603.pdf; Supplier Part Number 1: RC0603JR-0747KL; Supplier 2: Digi-Key; RoHS: Yes; Category: Chip SMD Resistors; Stock 2: 1087850; Pricing 2: 1=0.10000, 10=0.02300, 100=0.00930, 1000=0.00417, 2500=0.00362 (USD); Size Code: 0603; Number of Terminations: 2; Resistor Type: Thick Film; Features: Moisture Resistant; Series: RC; Max Power Dissipation: 100mW; Construction: Rectangular; RoHS Compliant: Yes; ComponentLink3URL: https://datasheet.ciiva.com/46395/443971-46395003.pdf?src-supplier=Element14; ComponentLink3Description: https://datasheet.ciiva.com/46395/443971-46395003.pdf?src-supplier=Element14; ComponentLink4URL: https://datasheet.ciiva.com/12558/rc0603-272842-12558744.pdf?src-supplier=Mouser; ComponentLink4Description: https://datasheet.ciiva.com/12558/rc0603-272842-12558744.pdf?src-supplier=Mouser; Supplier Part Number 2: 311-30.0KHRCT-ND; LCSC Part Number: C127447
R28 = RT0603BRE072KL: RES SMD 2K OHM 0.1% 1/10W 0603; Manufacturer: Yageo; Resistance: 2kR; Power Rating: 100mW; Temperature Coefficient: 50ppm/°C; Voltage Rating (DC): 50V; Item type: Resistor; Supplier 1: Future Electronics; Manufacturer Part Number: RT0603BRE072KL; RoHS: Yes; Category: Chip SMD Resistors; Stock 1: 85000; Pricing 1: 5000=0.03240, 15000=0.03120, 20000=0.03090, 50000=0.02990, 75000=0.02900 (USD); Case/Package: 0603; Case Code (Metric): 1608; Case Code (Imperial): 0603; Size Code: 0603; Min Operating Temperature: -55°C; Max Operating Temperature: 155°C; Package Quantity: 5000; Packaging: Tape and Reel; Tolerance: 0.1%; Resistor Type: Thin Film; Number of Terminations: 2; Max Power Dissipation: 100mW; Features: Moisture Resistant; Series: RT; Construction: Rectangular; Length: 0.063inch; Width: 0.031inch; Height: 0.022inch; Depth: 0.8mm; Military Standard: Not; Lead Free: Lead Free; RoHS Compliant: Yes; ComponentLink1URL: https://datasheet.ciiva.com/2584/pyu-rt-1-to-0-05-rohs-l-5-2584417.pdf?src-supplier=Digi-Key; ComponentLink1Description: https://datasheet.ciiva.com/2584/pyu-rt-1-to-0-05-rohs-l-5-2584417.pdf?src-supplier=Digi-Key; Supplier Part Number 1: 8298309; LCSC Part Number: C136954
SB1 = Solder Bridge 0603: Solder Bridge ON; Manufacturer Part Number: Solder Bridge; Item Type: Solder Bridge
U5 = TC358870XBG(NOK): Ultra HD to Display Serial Interface Converter 80-Pin VFBGA; Manufacturer: Toshiba; Item Type: IC; Manufaure Part Number: TC358870XBG(NOK); LCSC Part Number: C3008712; ComponentLink1Description: LCSC; Supplier: Mouser; Supplier Part Number: 757-TC358870XBG(NOK); Manufacturer Part Number: TC358870XBG(NOK); RoHS: Yes; Stock: 662; Pricing: 1=10.6, 10=9.75, 50=9.35, 100=8.24, 1000=7.32, 10000=6.71 (USD); Case/Package: VFBGA; Min Operating Temperature: -30°C; Max Operating Temperature: 70°C; ComponentLink2URL: http://toshiba.semicon-storage.com/info/docget.jsp?did=28743&prodName=TC358870XBG&src-supplier=Avnet; ComponentLink2Description: http://toshiba.semicon-storage.com/info/docget.jsp?did=28743&prodName=TC358870XBG&src-supplier=Avnet
X4 = O3240000153350: 3.3V 5mA ±25ppm 40MHz CMOS SMD3225-4P Oscillators ROHS; Manufacturer: JGHC; Item Type: Crystal; Manufacturer Part Number: O3240000153350; Value: 40MHZ; LCSC Part Number: C437132; ComponentLink1Description: LCSC; ComponentLink1URL: https://www.lcsc.com/product-detail/Oscillators_JGHC-O3240000153350_C437132.html

## Nets that join several sheets
1V1: Power_Section (5 pins), HDMI_to_MIPI_Section (C32.2 FB3.2)
1V8: Power_Section (5 pins), HDMI_to_MIPI_Section (5 pins)
2V8: Power_Section (C15.2 C17.2 U2.5), HDMI_to_MIPI_Section (J3.27 J3.28)
3V3: Power_Section (7 pins), Controller_Section (12 pins), HDMI_to_MIPI_Section (13 pins)
GND: Power_Section (35 pins), Connector_Section (12 pins), Controller_Section (18 pins), HDMI_to_MIPI_Section (58 pins)
VBUS: Power_Section (16 pins), Connector_Section (R31.1), Controller_Section (C28.1 J2.7 U4.6 U4.7)
B_RESX: Controller_Section (U3.46), HDMI_to_MIPI_Section (U5.K8)
CEC: Connector_Section (J4.13), HDMI_to_MIPI_Section (R34.2 U5.A2)
HDMIC_N: Connector_Section (D3.1 D3.10 J4.12), HDMI_to_MIPI_Section (U5.C2)
HDMIC_P: Connector_Section (D3.2 D3.9 J4.10), HDMI_to_MIPI_Section (U5.C1)
HDMID0_N: Connector_Section (D3.4 D3.7 J4.9), HDMI_to_MIPI_Section (U5.D2)
HDMID0_P: Connector_Section (D3.5 D3.6 J4.7), HDMI_to_MIPI_Section (U5.D1)
HDMID1_N: Connector_Section (D2.1 D2.10 J4.6), HDMI_to_MIPI_Section (U5.E2)
HDMID1_P: Connector_Section (D2.2 D2.9 J4.4), HDMI_to_MIPI_Section (U5.E1)
HDMID2_N: Connector_Section (D2.4 D2.7 J4.3), HDMI_to_MIPI_Section (U5.F2)
HDMID2_P: Connector_Section (D2.5 D2.6 J4.1), HDMI_to_MIPI_Section (U5.F1)
HPDI: Connector_Section (R33.1), HDMI_to_MIPI_Section (U5.A4)
HPDO: Connector_Section (L5.2 R32.1), HDMI_to_MIPI_Section (U5.B4)
INT: Controller_Section (U3.45), HDMI_to_MIPI_Section (R27.1 U5.J3)
R_DDC_SCL: Connector_Section (J4.15 R29.1), HDMI_to_MIPI_Section (U5.A3)
R_DDC_SDA: Connector_Section (J4.16 R30.1), HDMI_to_MIPI_Section (U5.B3)
R_I2C_SCL: Controller_Section (J2.6 U3.42), HDMI_to_MIPI_Section (R25.2 U5.K4)
R_I2C_SDA: Controller_Section (J2.8 U3.43), HDMI_to_MIPI_Section (R26.2 U5.K3)
USB_N: Power_Section (R9.2), Controller_Section (R17.1)
USB_P: Power_Section (R10.2), Controller_Section (R18.1)
USR_LED: Power_Section (LED2.2), Controller_Section (U3.21)